# Altium schematic sheet power.SchDoc
size A4
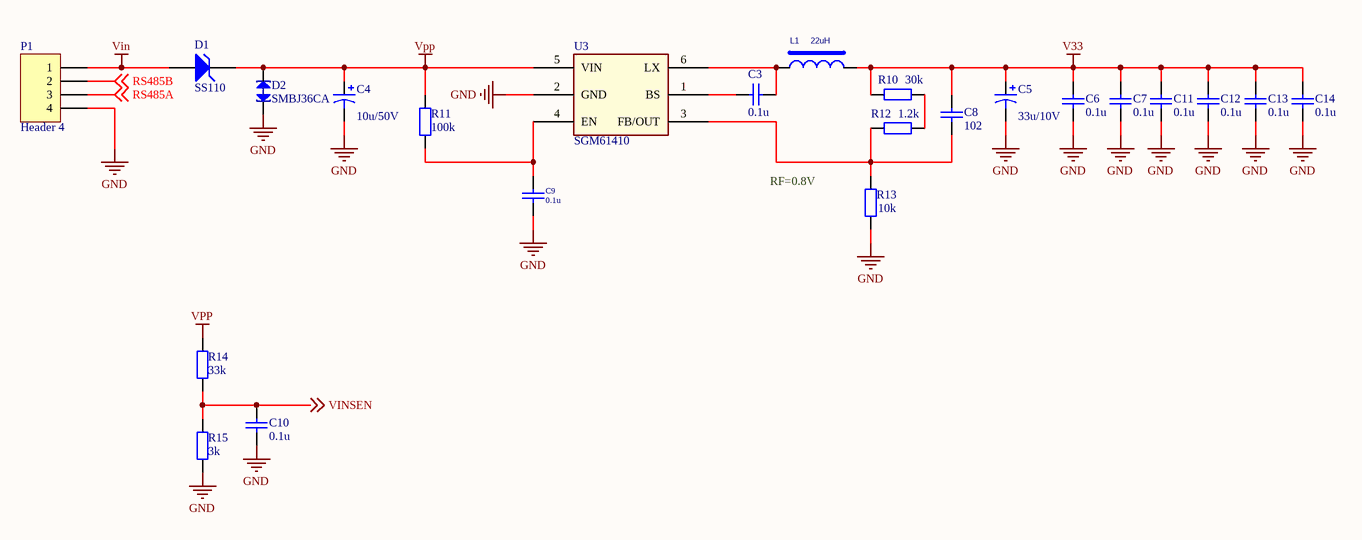
[diagram p0: power.SchDoc]

## Parts
C3  value 0.1u  [0603C]  (hidden comment: Cap)
C4  value 10u/50V  [E0.1]  (hidden comment: Cap Pol1)
C5  value 33u/10V  [E0.1]  (hidden comment: Cap Pol1)
C6  value 0.1u  [0603C]  (hidden comment: Cap)
C7  value 0.1u  [0603C]  (hidden comment: Cap)
C8  value 102  [0603C]  (hidden comment: Cap)
C9  value 0.1u  [0603C]  (hidden comment: Cap)
C10  value 0.1u  [0603C]  (hidden comment: Cap)
C11  value 0.1u  [0603C]  (hidden comment: Cap)
C12  value 0.1u  [0603C]  (hidden comment: Cap)
C13  value 0.1u  [0603C]  (hidden comment: Cap)
C14  value 0.1u  [0603C]  (hidden comment: Cap)
D1  SS110  [SMB]
D2  SMBJ36CA  [SMB]
L1  22uH  [MSS4018]
P1  Header 4  [HDR1X4]
R10  value 30k  [0603R]  (hidden comment: Res2)
R11  value 100k  [0603R]  (hidden comment: Res2)
R12  value 1.2k  [0603R]  (hidden comment: Res2)
R13  value 10k  [0603R]  (hidden comment: Res2)
R14  value 33k  [0603R]  (hidden comment: Res2)
R15  value 3k  [0603R]  (hidden comment: Res2)
U3  SGM61410  [sot-26]

## Nets
GND: C4.2 C5.2 C6.1 C7.1 C9.2 C10.1 C11.1 C12.1 C13.1 C14.1 D2.1(A) P1.4 R13.2 R15.1 U3.2(GND)
V33: C5.1 C6.2 C7.2 C8.2 C11.2 C12.2 C13.2 C14.2 L1.2 R10.1
Vin: D1.1(A) P1.1
VPP: C4.1 D1.2(K) D2.2(A) R11.1 R14.2 U3.5(VIN)
RS485A: P1.3 ; off-sheet RS485A
RS485B: P1.2 ; off-sheet RS485B
VINSEN: C10.2 R14.1 R15.2 ; off-sheet VINSEN
NetC3_1: C3.1 L1.1 U3.6(LX)
NetC3_2: C3.2 U3.1(BS)
NetC8_1: C8.1 R12.1 R13.1 U3.3(FB/OUT)
NetC9_1: C9.1 R11.2 U3.4(EN)
NetR10_2: R10.2 R12.2

## Notes on the sheet
- RF=0.8V

## Library data of the parts
C3 C6-C14 = Cap: Capacitor; Published: 8-Jun-2000; LatestRevisionDate: 17-Jul-2002; LatestRevisionNote: Re-released for DXP Platform.; PackageReference: RAD-0.3; Publisher: Altium Limited; PackageDescription: Radial Cap, Thru-Hole; 2 Leads; 0.3 in Pin Spacing
C4 C5 = Cap Pol1: Polarized Capacitor (Radial); Published: 8-Jun-2000; LatestRevisionDate: 17-Jul-2002; LatestRevisionNote: Re-released for DXP Platform.; PackageReference: RB7.6-15; Publisher: Altium Limited; PackageDescription: Polarized Capacitor (Radial); 2 Leads
D1 = D Zener: Zener Diode; Published: 8-Jun-2000; LatestRevisionDate: 17-Jul-2002; LatestRevisionNote: Re-released for DXP Platform.; PackageReference: DIODE-0.7; Publisher: Altium Limited; PackageDescription: Diode, Thru-Hole; 2 Leads; 0.7 in Pin Spacing
D2 = TVS_B
L1 = INDUCTORS OF FERRITE: Power Inductor,3.3uH,0.2,IND_404030; Manufacturer PN: SWPA4030S3R3MT; Manufacturer: sunlord; DC Resistor: 0.04ohm; Isat: 3.3A; Resonace frequency: 38M; Irms: 2.4A; Tolerance: 20%; Priority: A; Created by: YTL; Part Type: POWER_IND; RK PN: SWPA4030S3R3MT
P1 = Header 4: Header, 4-Pin; LatestRevisionDate: 17-Jul-2002; LatestRevisionNote: Re-released for DXP Platform.; Publisher: Altium Limited
R10-R15 = Res2: Resistor; Published: 8-Jun-2000; LatestRevisionDate: 17-Jul-2002; LatestRevisionNote: Re-released for DXP Platform.; PackageReference: AXIAL-0.4; Publisher: Altium Limited; PackageDescription: Axial Device, Thru-Hole; 2 Leads; 0.4 in Pin Spacing
U3 = RY8310